# Altium project Kindle Page Turner TX.PrjPcb
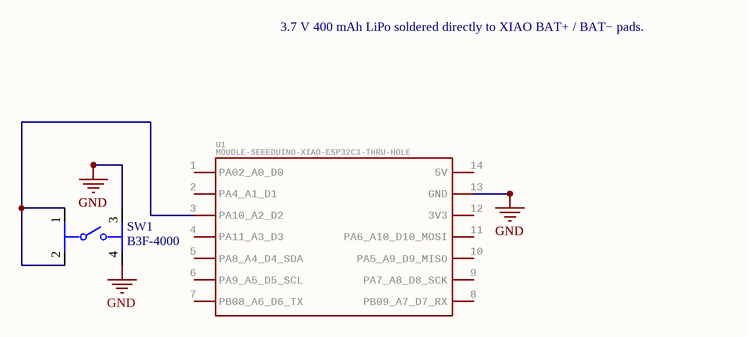
[diagram p0: TX Schematic.SchDoc]
1 sheet, 2 parts. Net scope: global (net labels, ports and power ports of the same name join across sheets).
Board file: Kindle_TX.PcbDoc

## Sheet TX Schematic.SchDoc
size A; SheetNumber: 1; SheetTotal: 1

### Parts
SW1  B3F-4000  [FP-B3F-4000-MFG]
U1  MOUDLE-SEEEDUINO-XIAO-ESP32C3-THRU-HOLE  [MOUDLE14P-2-54-21X17-8MM]

### Nets
GND: SW1.3 SW1.4 U1.13(GND)
NetSW1_1: SW1.1 SW1.2 U1.3(PA10_A2_D2)

Not connected (* = marked no-connect by the designer): U1 1(PA02_A0_D0) 2(PA4_A1_D1) 4(PA11_A3_D3) 5(PA8_A4_D4_SDA) 6(PA9_A5_D5_SCL) 7(PB08_A6_D6_TX) 8(PB09_A7_D7_RX) 9(PA7_A8_D8_SCK) 10(PA5_A9_D9_MISO) 11(PA6_A10_D10_MOSI) 12(3V3) 14(5V)

### Notes on the sheet
- 3.7 V 400 mAh LiPo soldered directly to XIAO BAT+ / BAT− pads.

### Library data of the parts
SW1 = CMP-08834-000001-1: SWITCH TACTILE SPST-NO 0.05A 24V; Manufacturer: Omron; Contact Current Rating: 50mA; Contact Resistance: 100mΩ; Operating Force: 1.27N; Electromechanical Life: 3000000Cycles; Digikey Description: SWITCH TACTILE SPST-NO 0.05A 24V; Automotive: No; Manufacturer Part Number: B3F-4000; Temperature Range High: +70°C; Octopart: https://octopart.com/b3f-4000-omron-22510; Mouser Description: Tactile Switches 12x12mm Std Ht 4.3 Gen Purpose 130g; Throw Configuration: SPST-NO; Height: 4.5mm; Voltage Rating Dc: 24V; Temperature: -25°C to +70°C; Device Class L1: Electromechanical; Device Class L2: Switches; Ambient Temperature Range Low: -25°C; Category: Switch; Mount: Through Hole; Device Class L3: Tactile Switches; RoHS: TRUE; ComponentLink2Description: Datasheet; Temperature Range Low: -25°C; Ambient Temperature Range High: +70°C; ComponentLink2URL: https://omronfs.omron.com/en_US/ecb/products/pdf/en-b3f.pdf; Package: B3F-4000; Lead Free: Yes
U1 = MOUDLE-SEEEDUINO-XIAO-ESP32C3-SMD: GateName_1: G$1; DeviceName: -SMD; SymbolName_1: MOUDLE-SEEEDUINO-XIAO-ESP32C3; LibraryName: Seeed-Studio-XIAO-ESP32C3-footprint-eagle; DeviceSetName: MOUDLE-SEEEDUINO-XIAO-ESP32C3; Package: MOUDLE14P-SMD-2.54-21X17.8MM